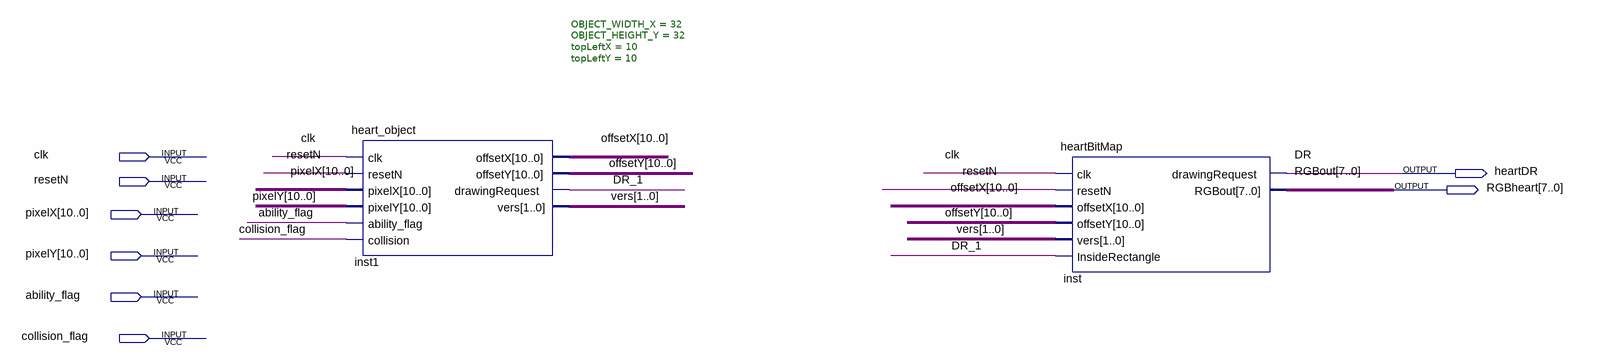
[diagram p0: schematic sheet]
// Quartus schematic heart_block_T.bdf as structural Verilog: 2 symbols, 8 pins
module heart_block_T (
  input  clk,
  input  resetN,
  input  [10:0] pixelX,
  input  [10:0] pixelY,
  input  ability_flag,
  input  collision_flag,
  output heartDR,
  output [7:0] RGBheart
);

  wire DR_1;
  wire [1:0] vers;
  wire [10:0] offsetX, offsetY;

  heart_object #(.OBJECT_WIDTH_X(32), .OBJECT_HEIGHT_Y(32), .topLeftX(10), .topLeftY(10)) inst1 (
    .clk(clk), .resetN(resetN), .pixelX(pixelX), .pixelY(pixelY), .ability_flag(ability_flag),
    .collision(collision_flag), .offsetX(offsetX), .offsetY(offsetY), .drawingRequest(DR_1), .vers(vers));
  heartBitMap inst (
    .clk(clk), .resetN(resetN), .offsetX(offsetX), .offsetY(offsetY), .vers(vers), .InsideRectangle(DR_1),
    .drawingRequest(heartDR), .RGBout(RGBheart));

  // Other names for the same wires on the sheet: DR = heartDR; RGBout[7:0] = RGBheart
endmodule
